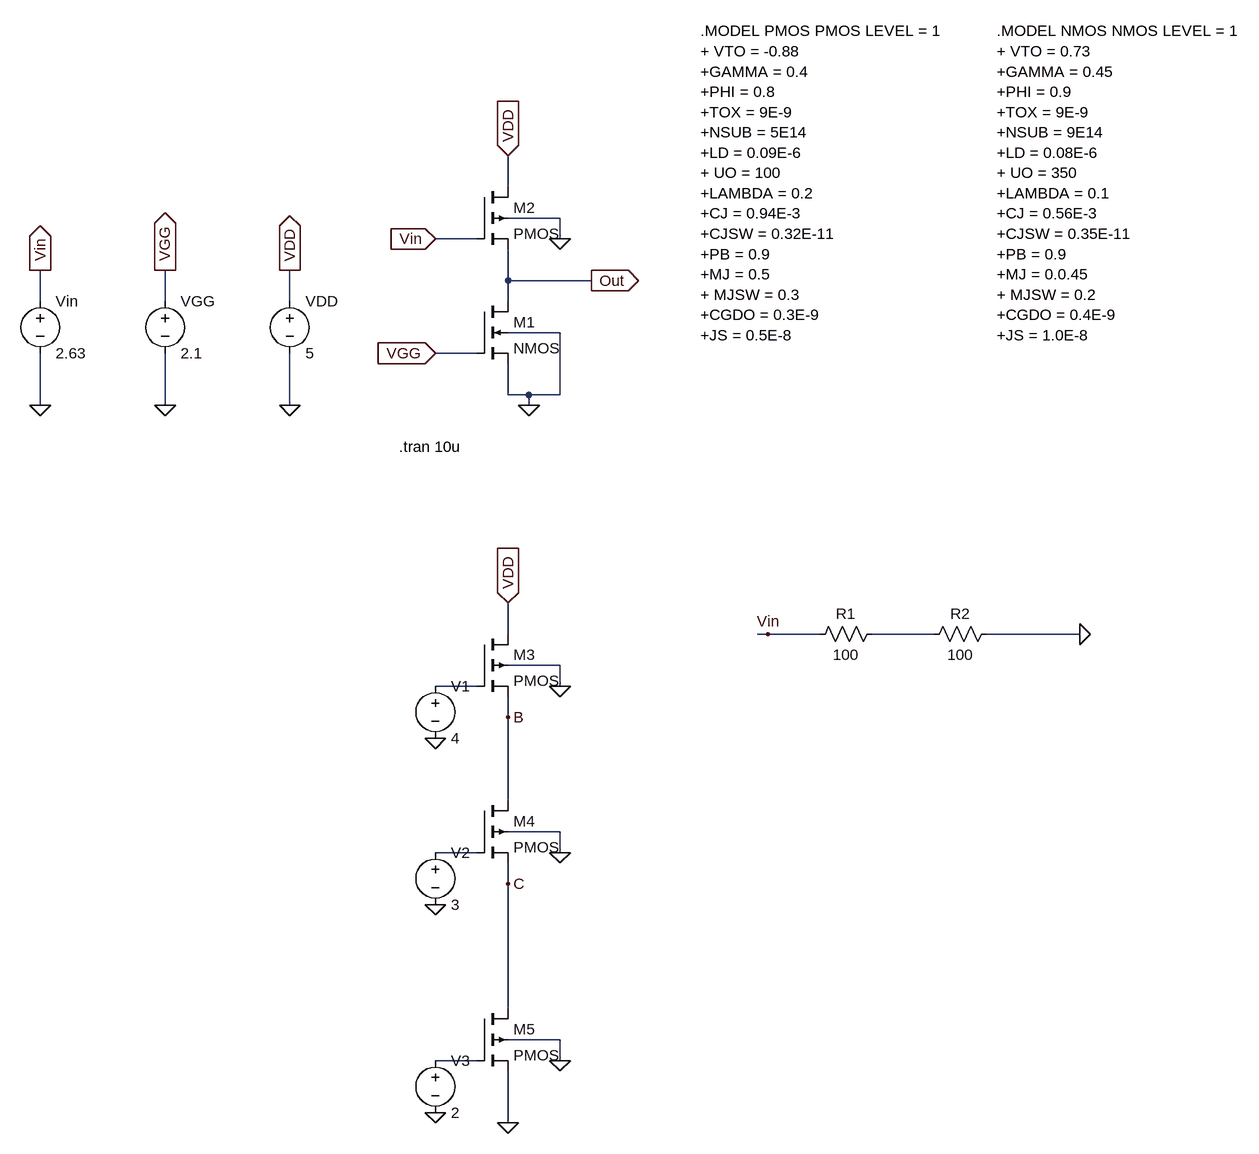
[diagram p0: schematic Simuleringsfil.asc]
Simuleringsfil.asc, the LTspice schematic file:
Version 4
SHEET 1 1272 1392
WIRE 176 -64 176 -112
WIRE 256 -16 176 -16
WIRE 128 16 64 16
WIRE 256 16 256 -16
WIRE 176 80 176 32
WIRE 304 80 176 80
WIRE -544 112 -544 64
WIRE -352 112 -352 64
WIRE -160 112 -160 64
WIRE 176 112 176 80
WIRE 256 160 176 160
WIRE 128 192 64 192
WIRE 176 256 176 208
WIRE 208 256 176 256
WIRE 256 256 256 160
WIRE 256 256 208 256
WIRE -544 272 -544 192
WIRE -352 272 -352 192
WIRE -160 272 -160 192
WIRE 208 272 208 256
WIRE 176 624 176 576
WIRE 576 624 560 624
WIRE 656 624 576 624
WIRE 832 624 736 624
WIRE 1056 624 912 624
WIRE 256 672 176 672
WIRE 128 704 64 704
WIRE 256 704 256 672
WIRE 176 752 176 720
WIRE 176 880 176 752
WIRE 256 928 176 928
WIRE 128 960 64 960
WIRE 256 960 256 928
WIRE 176 1008 176 976
WIRE 176 1200 176 1008
WIRE 256 1248 176 1248
WIRE 128 1280 64 1280
WIRE 256 1280 256 1248
WIRE 176 1376 176 1296
FLAG 256 16 0
FLAG 208 272 0
FLAG -160 272 0
FLAG -352 272 0
FLAG -544 272 0
FLAG -544 64 Vin
IOPIN -544 64 Out
FLAG -352 64 VGG
IOPIN -352 64 Out
FLAG -160 64 VDD
IOPIN -160 64 Out
FLAG 64 192 VGG
IOPIN 64 192 In
FLAG 64 16 Vin
IOPIN 64 16 In
FLAG 176 -112 VDD
IOPIN 176 -112 In
FLAG 304 80 Out
IOPIN 304 80 Out
FLAG 1056 624 0
FLAG 576 624 Vin
FLAG 256 704 0
FLAG 176 576 VDD
IOPIN 176 576 In
FLAG 256 960 0
FLAG 256 1280 0
FLAG 176 1376 0
FLAG 176 752 B
FLAG 176 1008 C
FLAG 64 784 0
FLAG 64 1040 0
FLAG 64 1360 0
SYMBOL pmos4 128 -64 R0
SYMATTR InstName M2
SYMATTR Value2 l=1u w=5u
SYMBOL nmos4 128 112 R0
SYMATTR InstName M1
SYMATTR Value2 l=1u w=1u
SYMBOL Voltage -544 96 R0
SYMATTR InstName Vin
SYMATTR Value 2.63
SYMBOL Voltage -352 96 R0
SYMATTR InstName VGG
SYMATTR Value 2.1
SYMBOL Voltage -160 96 R0
SYMATTR InstName VDD
SYMATTR Value 5
SYMBOL Res 640 640 R270
WINDOW 0 32 56 VTop 2
WINDOW 3 0 56 VBottom 2
SYMATTR InstName R1
SYMATTR Value 100
SYMBOL Res 816 640 R270
WINDOW 0 32 56 VTop 2
WINDOW 3 0 56 VBottom 2
SYMATTR InstName R2
SYMATTR Value 100
SYMBOL pmos4 128 624 R0
SYMATTR InstName M3
SYMATTR Value2 l=1u w=5u
SYMBOL pmos4 128 880 R0
SYMATTR InstName M4
SYMATTR Value2 l=1u w=5u
SYMBOL pmos4 128 1200 R0
SYMATTR InstName M5
SYMATTR Value2 l=1u w=5u
SYMBOL Voltage 64 688 R0
SYMATTR InstName V1
SYMATTR Value 4
SYMBOL Voltage 64 944 R0
SYMATTR InstName V2
SYMATTR Value 3
SYMBOL Voltage 64 1264 R0
SYMATTR InstName V3
SYMATTR Value 2
TEXT 8 336 Left 2 !.tran 10u
TEXT 472 -304 Left 2 !.MODEL PMOS PMOS LEVEL = 1\n+ VTO = -0.88\n+GAMMA = 0.4\n+PHI = 0.8\n+TOX = 9E-9\n+NSUB = 5E14\n+LD = 0.09E-6\n+ UO = 100\n+LAMBDA = 0.2\n+CJ = 0.94E-3\n+CJSW = 0.32E-11\n+PB = 0.9\n+MJ = 0.5\n+ MJSW = 0.3\n+CGDO = 0.3E-9\n+JS = 0.5E-8
TEXT 928 -304 Left 2 !.MODEL NMOS NMOS LEVEL = 1\n+ VTO = 0.73\n+GAMMA = 0.45\n+PHI = 0.9\n+TOX = 9E-9\n+NSUB = 9E14\n+LD = 0.08E-6\n+ UO = 350\n+LAMBDA = 0.1\n+CJ = 0.56E-3\n+CJSW = 0.35E-11\n+PB = 0.9\n+MJ = 0.0.45\n+ MJSW = 0.2\n+CGDO = 0.4E-9\n+JS = 1.0E-8

The netlist it stands for:
* Simuleringsfil.asc
M2 VDD Vin Out 0 PMOS l=1u w=5u
M1 Out VGG 0 0 NMOS l=1u w=1u
Vin Vin 0 2.63
VGG VGG 0 2.1
VDD VDD 0 5
R1 Vin N001 100
R2 N001 0 100
M3 VDD N002 B 0 PMOS l=1u w=5u
M4 B N003 C 0 PMOS l=1u w=5u
M5 C N004 0 0 PMOS l=1u w=5u
V1 N002 0 4
V2 N003 0 3
V3 N004 0 2
.model NMOS NMOS
.model PMOS PMOS
.lib standard.mos
.tran 10u
.MODEL PMOS PMOS LEVEL = 1
+ VTO = -0.88
+GAMMA = 0.4
+PHI = 0.8
+TOX = 9E-9
+NSUB = 5E14
+LD = 0.09E-6
+ UO = 100
+LAMBDA = 0.2
+CJ = 0.94E-3
+CJSW = 0.32E-11
+PB = 0.9
+MJ = 0.5
+ MJSW = 0.3
+CGDO = 0.3E-9
+JS = 0.5E-8
.MODEL NMOS NMOS LEVEL = 1
+ VTO = 0.73
+GAMMA = 0.45
+PHI = 0.9
+TOX = 9E-9
+NSUB = 9E14
+LD = 0.08E-6
+ UO = 350
+LAMBDA = 0.1
+CJ = 0.56E-3
+CJSW = 0.35E-11
+PB = 0.9
+MJ = 0.0.45
+ MJSW = 0.2
+CGDO = 0.4E-9
+JS = 1.0E-8
.backanno
.end